# Altium schematic sheet Controller-Driver-Sheet-1.SchDoc (part 1 of 3)
size 420 x 297 mm; SheetNumber: 4; SheetTotal: 15
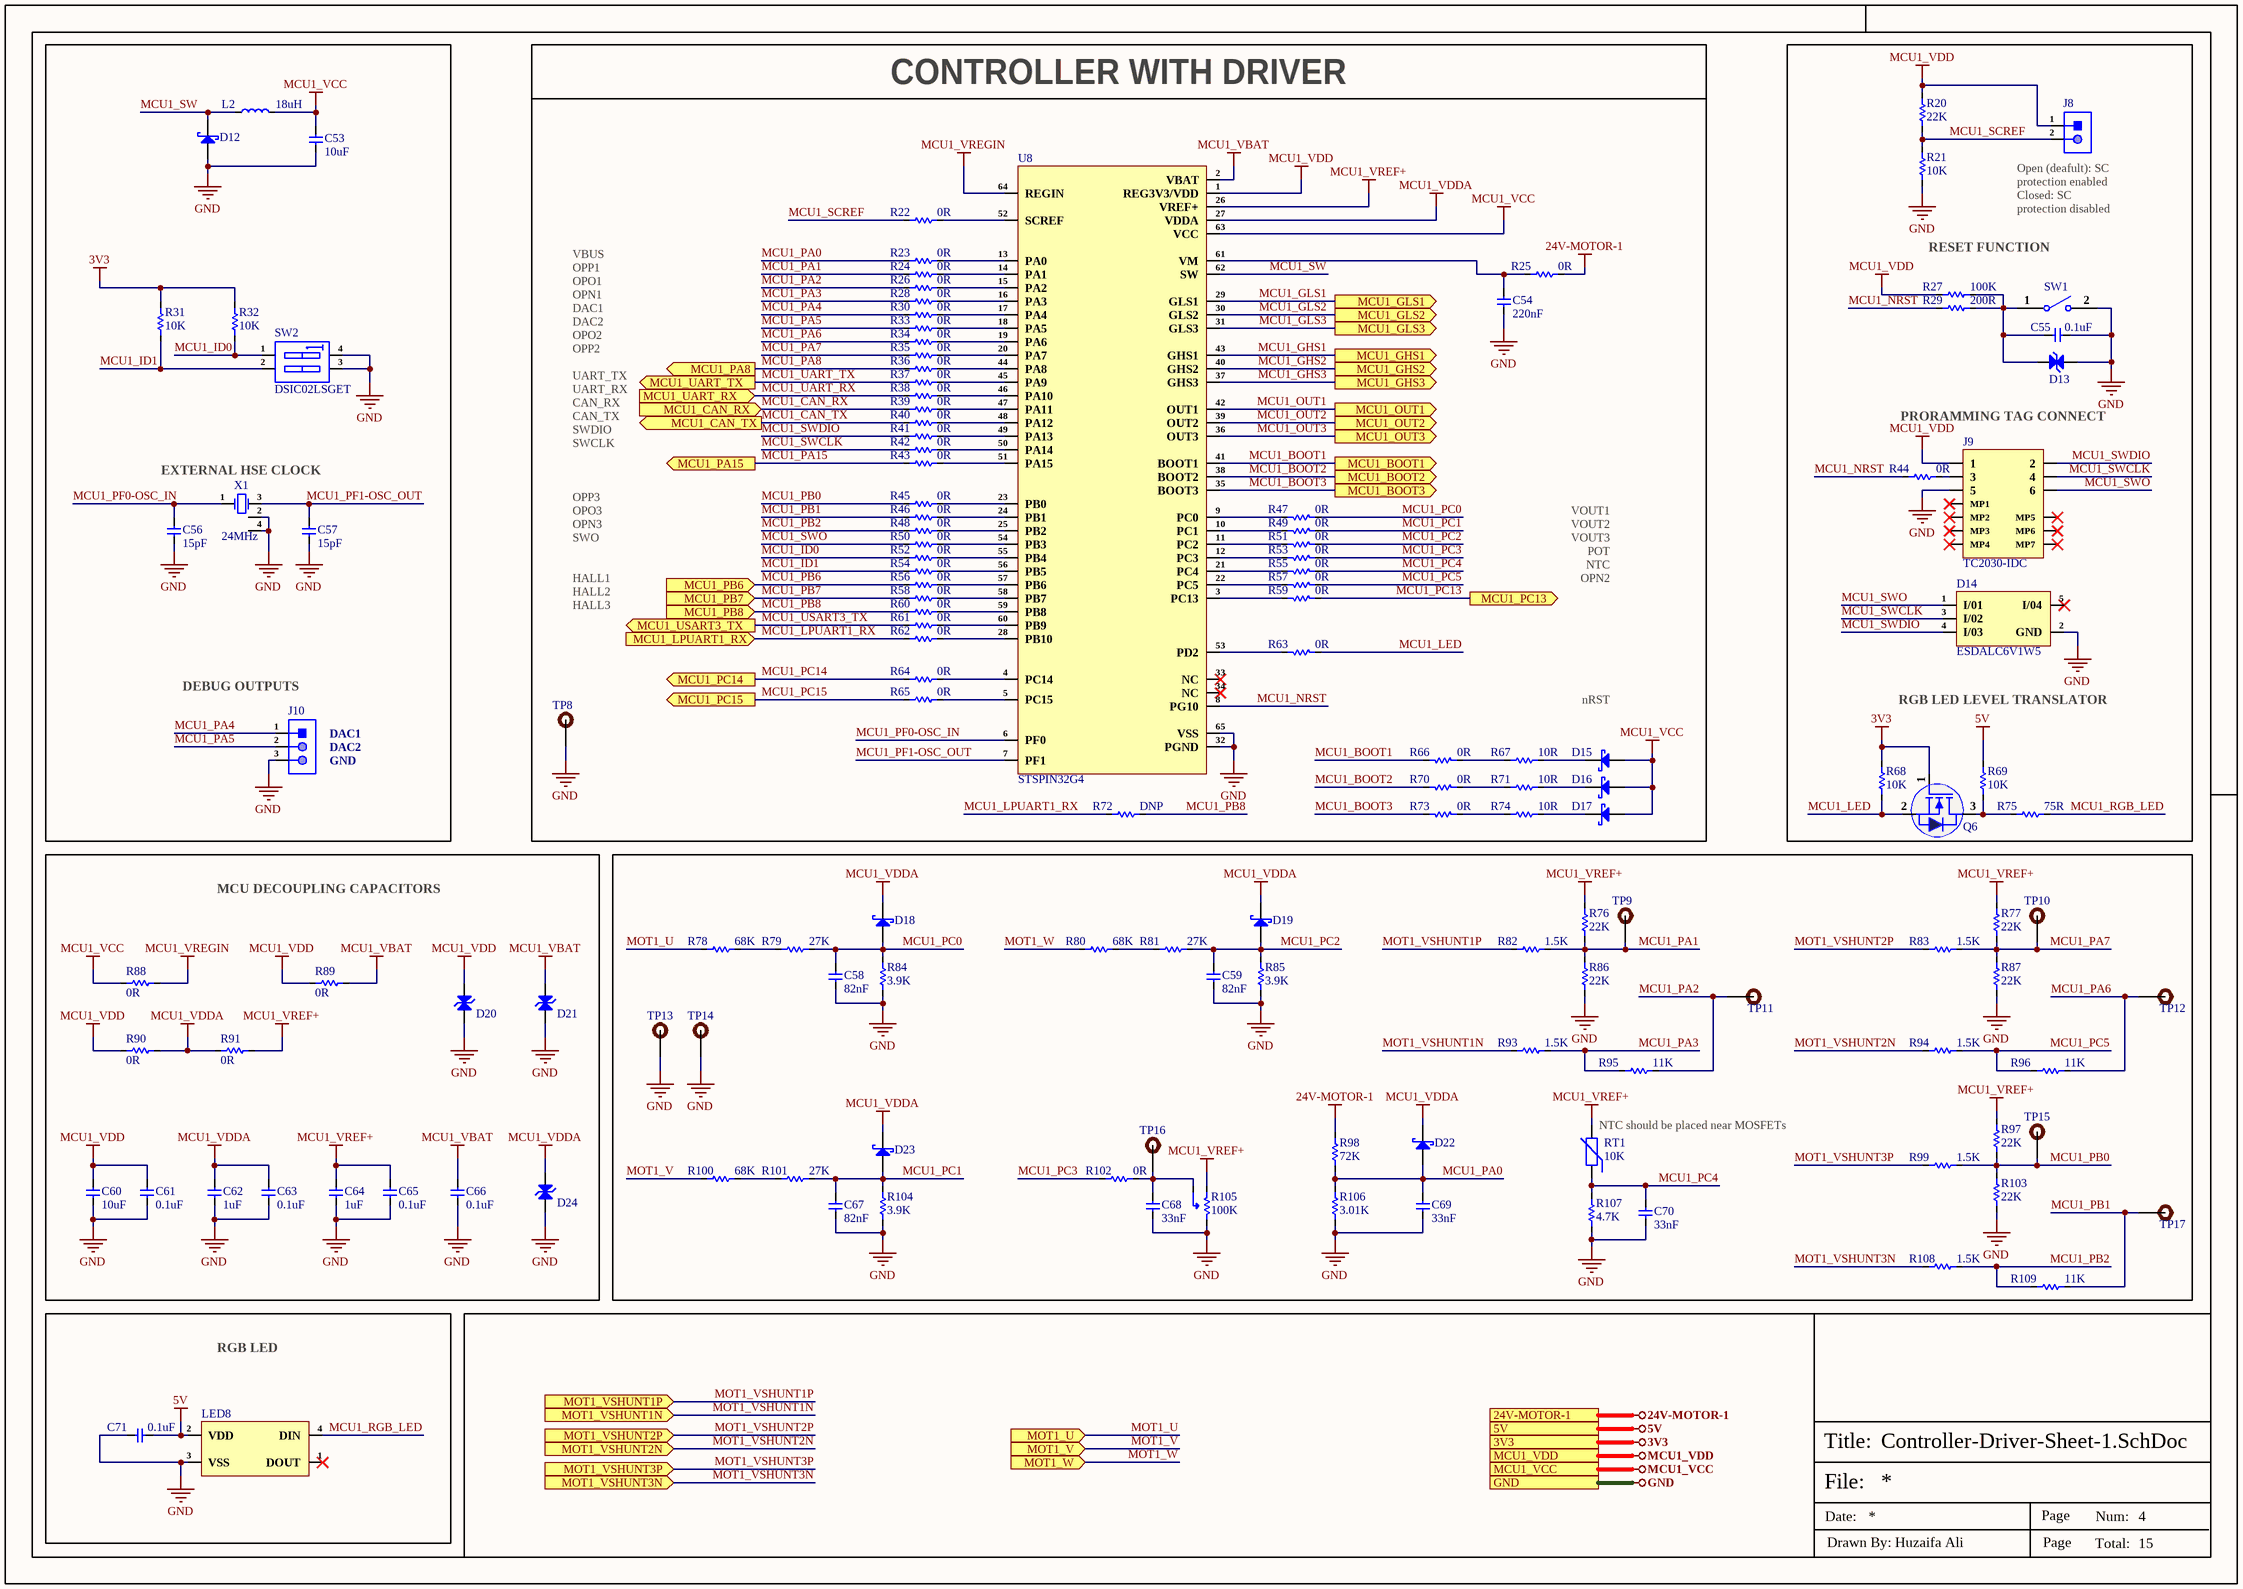
[diagram p0: Controller-Driver-Sheet-1.SchDoc]

## Parts
C53  10uF  [Cap-0805]
C54  220nF  [Cap-0805]
C55  0.1uF  [Cap-0402]
C56  15pF  [Cap-0201]
C57  15pF  [Cap-0201]
C58  82nF  [Cap-0603]
C59  82nF  [Cap-0603]
C60  10uF  [Cap-0603]
C61  0.1uF  [Cap-0402]
C62  1uF  [Cap-0402]
C63  0.1uF  [Cap-0402]
C64  1uF  [Cap-0402]
C65  0.1uF  [Cap-0402]
C66  0.1uF  [Cap-0402]
C67  82nF  [Cap-0603]
C68  33nF  [Cap-0603]
C69  33nF  [Cap-0603]
C70  33nF  [Cap-0603]
C71  0.1uF  [Cap-0402]
D12  STPS1H100A  [SMA]  (value not drawn)
D13  ESDM2033MX4T5G  [DFN-2(0.3x0.6)]  (value not drawn)
D14  ESDALC6V1W5  [SOT-323-5]
D15  BAT46ZFILM  [SOD-123]  (value not drawn)
D16  BAT46ZFILM  [SOD-123]  (value not drawn)
D17  BAT46ZFILM  [SOD-123]  (value not drawn)
D18  BAT30KFILM  [SOD-523]  (value not drawn)
D19  BAT30KFILM  [SOD-523]  (value not drawn)
D20  ESDM2033MX4T5G  [DFN-2(0.3x0.6)]  (value not drawn)
D21  ESDM2033MX4T5G  [DFN-2(0.3x0.6)]  (value not drawn)
D22  BAT30KFILM  [SOD-523]  (value not drawn)
D23  BAT30KFILM  [SOD-523]  (value not drawn)
D24  ESDM2033MX4T5G  [DFN-2(0.3x0.6)]  (value not drawn)
J8  X6511WV-02H-C60D30  [HDR1X2_]  (value not drawn)
J9  TC2030-IDC  [TC2030-IDC_]
J10  X6511WV-03H-C60D30  [HDR1X3_]  (value not drawn)
L2  18uH  [FNR5040S180MT]
LED8  WS2812D-F5  [WS2812D-F5]  (value not drawn)
Q6  Si2302CDS  [Sot-23]  (value not drawn)
R20  22K  [Res-0402]
R21  10K  [Res-0402]
R22  0R  [Res-0402]
R23  0R  [Res-0402]
R24  0R  [Res-0402]
R25  0R  [Res-0805]
R26  0R  [Res-0402]
R27  100K  [Res-0402]
R28  0R  [Res-0402]
R29  200R  [Res-0402]
R30  0R  [Res-0402]
R31  10K  [Res-0402]
R32  10K  [Res-0402]
R33  0R  [Res-0402]
R34  0R  [Res-0402]
R35  0R  [Res-0402]
R36  0R  [Res-0402]
R37  0R  [Res-0402]
R38  0R  [Res-0402]
R39  0R  [Res-0402]
R40  0R  [Res-0402]
R41  0R  [Res-0402]
R42  0R  [Res-0402]
R43  0R  [Res-0402]
R44  0R  [Res-0402]
R45  0R  [Res-0402]
R46  0R  [Res-0402]
R47  0R  [Res-0402]
R48  0R  [Res-0402]
R49  0R  [Res-0402]
R50  0R  [Res-0402]
R51  0R  [Res-0402]
R52  0R  [Res-0402]
R53  0R  [Res-0402]
R54  0R  [Res-0402]
R55  0R  [Res-0402]
R56  0R  [Res-0402]
R57  0R  [Res-0402]
R58  0R  [Res-0402]
R59  0R  [Res-0402]
R60  0R  [Res-0402]
R61  0R  [Res-0402]
R62  0R  [Res-0402]
R63  0R  [Res-0402]
R64  0R  [Res-0402]
R65  0R  [Res-0402]
R66  0R  [Res-0402]
R67  10R  [Res-0603]
R68  10K  [Res-0402]
R69  10K  [Res-0402]
R70  0R  [Res-0402]
R71  10R  [Res-0603]
R72  DNP  [Res-0402]
R73  0R  [Res-0402]
R74  10R  [Res-0603]
R75  75R  [Res-0402]
R76  22K  [Res-0402]
R77  22K  [Res-0402]
R78  68K  [Res-0603]
R79  27K  [Res-0603]
R80  68K  [Res-0603]
R81  27K  [Res-0603]
R82  1.5K  [Res-0402]
R83  1.5K  [Res-0402]
R84  3.9K  [Res-0603]
R85  3.9K  [Res-0603]
R86  22K  [Res-0402]
R87  22K  [Res-0402]
R88  0R  [Res-0805]
R89  0R  [Res-0805]
R90  0R  [Res-0805]
R91  0R  [Res-0805]
R93  1.5K  [Res-0402]
R94  1.5K  [Res-0402]
R95  11K  [Res-0402]
R96  11K  [Res-0402]
R97  22K  [Res-0402]
R98  72K  [Res-0603]
R99  1.5K  [Res-0402]
R100  68K  [Res-0603]
R101  27K  [Res-0603]
R102  0R  [Res-0805]
R103  22K  [Res-0402]
R104  3.9K  [Res-0603]
R105  100K  [3386P-1-104TLF]
R106  3.01K  [Res-0603]
R107  4.7K  [Res-0402]
R108  1.5K  [Res-0402]
R109  11K  [Res-0402]
RT1  10K  [Res-0603]
SW1  B3U-1000P  [B3U-1000P]  (value not drawn)
SW2  DSIC02LSGET  [DSIC02LSGET]
TP8  TEST POINT  [Test-point]  (value not drawn)  (no BOM)
TP9  TEST POINT  [Test-point]  (value not drawn)  (no BOM)
TP10  TEST POINT  [Test-point]  (value not drawn)  (no BOM)
TP11  TEST POINT  [Test-point]  (value not drawn)  (no BOM)
TP12  TEST POINT  [Test-point]  (value not drawn)  (no BOM)
TP13  TEST POINT  [Test-point]  (value not drawn)  (no BOM)
TP14  TEST POINT  [Test-point]  (value not drawn)  (no BOM)
TP15  TEST POINT  [Test-point]  (value not drawn)  (no BOM)
TP16  TEST POINT  [Test-point]  (value not drawn)  (no BOM)
TP17  TEST POINT  [Test-point]  (value not drawn)  (no BOM)
U8  STSPIN32G4  [64-VFQFPN 9X9]
X1  24MHz  [SMD2016-4P]

## Blocks framed on the sheet
CONTROLLER WITH DRIVER: C54 D15-D17 R22-R26 R28 R30 R33-R43 R45-R67 R70-R74 TP8 U8
MCU DECOUPLING CAPACITORS: C60-C66 D20 D21 D24 R88-R91
NTC should be placed near MOSFETs: C58 C59 C67-C70 D18 D19 D22 D23 R76-R87 R93-R109 RT1 TP9-TP17
RGB LED: C71 LED8

## Ports
3V3, 5V, 24V-MOTOR-1, GND, MCU1_BOOT1 (out), MCU1_BOOT2 (out), MCU1_BOOT3 (out), MCU1_CAN_RX (in), MCU1_CAN_TX (out), MCU1_GHS1 (out), MCU1_GHS2 (out), MCU1_GHS3 (out), MCU1_GLS1 (out), MCU1_GLS2 (out), MCU1_GLS3 (out), MCU1_LPUART1_RX (in), MCU1_OUT1 (out), MCU1_OUT2 (out), MCU1_OUT3 (out), MCU1_PA8 (out), MCU1_PA15 (out), MCU1_PB6 (in), MCU1_PB7 (in), MCU1_PB8 (in), MCU1_PC13 (out), MCU1_PC14 (out), MCU1_PC15 (out), MCU1_UART_RX (in), MCU1_UART_TX (out), MCU1_USART3_TX (out), MCU1_VCC, MCU1_VDD, MOT1_U (in), MOT1_V (in), MOT1_VSHUNT1N (in), MOT1_VSHUNT1P (in), MOT1_VSHUNT2N (in), MOT1_VSHUNT2P (in), MOT1_VSHUNT3N (in), MOT1_VSHUNT3P (in), MOT1_W (in)

## Nets
3V3: Q6.1(G) R31.2 R32.2 R68.2 ; port 3V3
5V: C71.2 LED8.2(VDD) R69.2 ; port 5V
24V-MOTOR-1: R25.2 R98.2 ; port 24V-MOTOR-1
GND: C53.1 C54.1 C55.1 C56.1 C57.1 C58.1 C59.1 C60.1 C61.1 C62.1 C63.1 C64.1 C65.1 C66.1 C67.1 C68.1 C69.1 C70.1 C71.1 D12.2(A) D13.1(A) D14.2(GND) D20.1(A) D21.1(A) D24.1(A) J9.5 J10.3 LED8.3(VSS) R21.1 R84.1 R85.1 R86.1 R87.1 R103.1 R104.1 R105.3(CW) R106.1 R107.1 SW1.2 SW2.3(A3) SW2.4(B3) TP8.1 TP13.1 TP14.1 U8.32(PGND) U8.65(VSS) X1.2(GND) X1.4(GND) ; port GND
MCU1_VBAT: C66.2 D21.2(A) R89.2 U8.2(VBAT)
MCU1_VCC: C53.2 D15.1(A) D16.1(A) D17.1(A) L2.2 R88.1 U8.63(VCC) ; port MCU1_VCC
MCU1_VDD: C60.2 C61.2 D20.2(A) J8.1 J9.1 R20.2 R27.1 R89.1 R90.1 U8.1(REG3V3/VDD) ; port MCU1_VDD
MCU1_VDDA: C62.2 C63.2 D18.2(K) D19.2(K) D22.2(K) D23.2(K) D24.2(A) R90.2 R91.1 U8.27(VDDA)
MCU1_VREF+: C64.2 C65.2 R76.2 R77.2 R91.2 R97.2 R105.1(CCW) RT1.2 U8.26(VREF+)
MCU1_VREGIN: R88.2 U8.64(REGIN)
MCU1_BOOT1: R66.1 U8.41(BOOT1) ; port MCU1_BOOT1
MCU1_BOOT2: R70.1 U8.38(BOOT2) ; port MCU1_BOOT2
MCU1_BOOT3: R73.1 U8.35(BOOT3) ; port MCU1_BOOT3
MCU1_CAN_RX: R39.2 ; port MCU1_CAN_RX
MCU1_CAN_TX: R40.2 ; port MCU1_CAN_TX
MCU1_GHS1: U8.43(GHS1) ; port MCU1_GHS1
MCU1_GHS2: U8.40(GHS2) ; port MCU1_GHS2
MCU1_GHS3: U8.37(GHS3) ; port MCU1_GHS3
MCU1_GLS1: U8.29(GLS1) ; port MCU1_GLS1
MCU1_GLS2: U8.30(GLS2) ; port MCU1_GLS2
MCU1_GLS3: U8.31(GLS3) ; port MCU1_GLS3
MCU1_ID0: R32.1 R52.2 SW2.1(A1)
MCU1_ID1: R31.1 R54.2 SW2.2(A2)
MCU1_LED: Q6.2(S) R63.2 R68.1
MCU1_LPUART1_RX: R62.2 R72.2 ; port MCU1_LPUART1_RX
MCU1_NRST: R29.1 R44.2 U8.8(PG10)
MCU1_OUT1: U8.42(OUT1) ; port MCU1_OUT1
MCU1_OUT2: U8.39(OUT2) ; port MCU1_OUT2
MCU1_OUT3: U8.36(OUT3) ; port MCU1_OUT3
MCU1_PA0: C69.2 D22.1(A) R23.2 R98.1 R106.2
MCU1_PA1: R24.2 R76.1 R82.2 R86.2 TP9.1
MCU1_PA2: R26.2 R95.2 TP11.1
MCU1_PA3: R28.2 R93.2 R95.1
MCU1_PA4: J10.1 R30.2
MCU1_PA5: J10.2 R33.2
MCU1_PA6: R34.2 R96.2 TP12.1
MCU1_PA7: R35.2 R77.1 R83.2 R87.2 TP10.1
MCU1_PA8: R36.2 ; port MCU1_PA8
MCU1_PA15: R43.2 ; port MCU1_PA15
MCU1_PB0: R45.2 R97.1 R99.2 R103.2 TP15.1
MCU1_PB1: R46.2 R109.2 TP17.1
MCU1_PB2: R48.2 R108.2 R109.1
MCU1_PB6: R56.2 ; port MCU1_PB6
MCU1_PB7: R58.2 ; port MCU1_PB7
MCU1_PB8: R60.2 R72.1 ; port MCU1_PB8
MCU1_PC0: C58.2 D18.1(A) R47.2 R79.2 R84.2
MCU1_PC1: C67.2 D23.1(A) R49.2 R101.2 R104.2
MCU1_PC2: C59.2 D19.1(A) R51.2 R81.2 R85.2
MCU1_PC3: R53.2 R102.1
MCU1_PC4: C70.2 R55.2 R107.2 RT1.1
MCU1_PC5: R57.2 R94.2 R96.1
MCU1_PC13: R59.2 ; port MCU1_PC13
MCU1_PC14: R64.2 ; port MCU1_PC14
MCU1_PC15: R65.2 ; port MCU1_PC15
MCU1_PF0-OSC_IN: C56.2 U8.6(PF0) X1.1(OSC1)
MCU1_PF1-OSC_OUT: C57.2 U8.7(PF1) X1.3(OSC2)
MCU1_RGB_LED: LED8.4(DIN) R75.2
MCU1_SCREF: J8.2 R20.1 R21.2 R22.2
MCU1_SW: D12.1(K) L2.1 U8.62(SW)
MCU1_SWCLK: D14.3(I/02) J9.4 R42.2
MCU1_SWDIO: D14.4(I/03) J9.2 R41.2
MCU1_SWO: D14.1(I/01) J9.6 R50.2
MCU1_UART_RX: R38.2 ; port MCU1_UART_RX
MCU1_UART_TX: R37.2 ; port MCU1_UART_TX
MCU1_USART3_TX: R61.2 ; port MCU1_USART3_TX
MOT1_U: R78.1 ; port MOT1_U
MOT1_V: R100.1 ; port MOT1_V
MOT1_VSHUNT1N: R93.1 ; port MOT1_VSHUNT1N
MOT1_VSHUNT1P: R82.1 ; port MOT1_VSHUNT1P
MOT1_VSHUNT2N: R94.1 ; port MOT1_VSHUNT2N
MOT1_VSHUNT2P: R83.1 ; port MOT1_VSHUNT2P
MOT1_VSHUNT3N: R108.1 ; port MOT1_VSHUNT3N
MOT1_VSHUNT3P: R99.1 ; port MOT1_VSHUNT3P
MOT1_W: R80.1 ; port MOT1_W
NetC54_2: C54.2 R25.1 U8.61(VM)
NetC55_2: C55.2 D13.2(A) R27.2 R29.2 SW1.1
NetC68_2: C68.2 R102.2 R105.2(Wiper) TP16.1
NetD15_2: D15.2(K) R67.2
NetD16_2: D16.2(K) R71.2
NetD17_2: D17.2(K) R74.2
NetJ9_3: J9.3 R44.1
NetQ6_3: Q6.3(D) R69.1 R75.1
NetR22_1: R22.1 U8.52(SCREF)
NetR23_1: R23.1 U8.13(PA0)
NetR24_1: R24.1 U8.14(PA1)
NetR26_1: R26.1 U8.15(PA2)
NetR28_1: R28.1 U8.16(PA3)
NetR30_1: R30.1 U8.17(PA4)
NetR33_1: R33.1 U8.18(PA5)
NetR34_1: R34.1 U8.19(PA6)
NetR35_1: R35.1 U8.20(PA7)
NetR36_1: R36.1 U8.44(PA8)
NetR37_1: R37.1 U8.45(PA9)
NetR38_1: R38.1 U8.46(PA10)
NetR39_1: R39.1 U8.47(PA11)
NetR40_1: R40.1 U8.48(PA12)
NetR41_1: R41.1 U8.49(PA13)
NetR42_1: R42.1 U8.50(PA14)
NetR43_1: R43.1 U8.51(PA15)
NetR45_1: R45.1 U8.23(PB0)
NetR46_1: R46.1 U8.24(PB1)
NetR47_1: R47.1 U8.9(PC0)
NetR48_1: R48.1 U8.25(PB2)
NetR49_1: R49.1 U8.10(PC1)
NetR50_1: R50.1 U8.54(PB3)
NetR51_1: R51.1 U8.11(PC2)
NetR52_1: R52.1 U8.55(PB4)
NetR53_1: R53.1 U8.12(PC3)
NetR54_1: R54.1 U8.56(PB5)
NetR55_1: R55.1 U8.21(PC4)
NetR56_1: R56.1 U8.57(PB6)
NetR57_1: R57.1 U8.22(PC5)
NetR58_1: R58.1 U8.58(PB7)
NetR59_1: R59.1 U8.3(PC13)
NetR60_1: R60.1 U8.59(PB8)
NetR61_1: R61.1 U8.60(PB9)
NetR62_1: R62.1 U8.28(PB10)
NetR63_1: R63.1 U8.53(PD2)
NetR64_1: R64.1 U8.4(PC14)
NetR65_1: R65.1 U8.5(PC15)
NetR66_2: R66.2 R67.1
NetR70_2: R70.2 R71.1
NetR73_2: R73.2 R74.1
NetR78_2: R78.2 R79.1
NetR80_2: R80.2 R81.1
NetR100_2: R100.2 R101.1

Not connected (* = marked no-connect by the designer): D14 5(I/04)*; J9 MP1* MP2* MP3* MP4* MP5* MP6* MP7*; LED8 1(DOUT)*; U8 33(NC)* 34(NC)*

## Notes on the sheet
- VBUS
- OPP1
- RESET FUNCTION
- (near J8) Open (deafult): SC protection enabled
  Closed: SC protection disabled
- OPO1
- OPN1
- DAC1
- DAC2
- OPO2
- OPP2
- UART_TX
- UART_RX
- CAN_RX
- CAN_TX
- SWDIO
- SWCLK
- PRORAMMING TAG CONNECT
- (near X1) EXTERNAL HSE CLOCK
- OPP3
- OPO3
- OPN3
- SWO
- VOUT1
- VOUT2
- VOUT3
- HALL1
- HALL2
- POT
- NTC
- OPN2
- HALL3
- (near J10) DEBUG OUTPUTS
- (near J10) DAC1
- nRST
- RGB LED LEVEL TRANSLATOR
- (near J10) DAC2
- (near J10) GND
- File:
- Title:
- Date:
- Page
- Num:
- Total:
- Drawn By: Huzaifa Ali